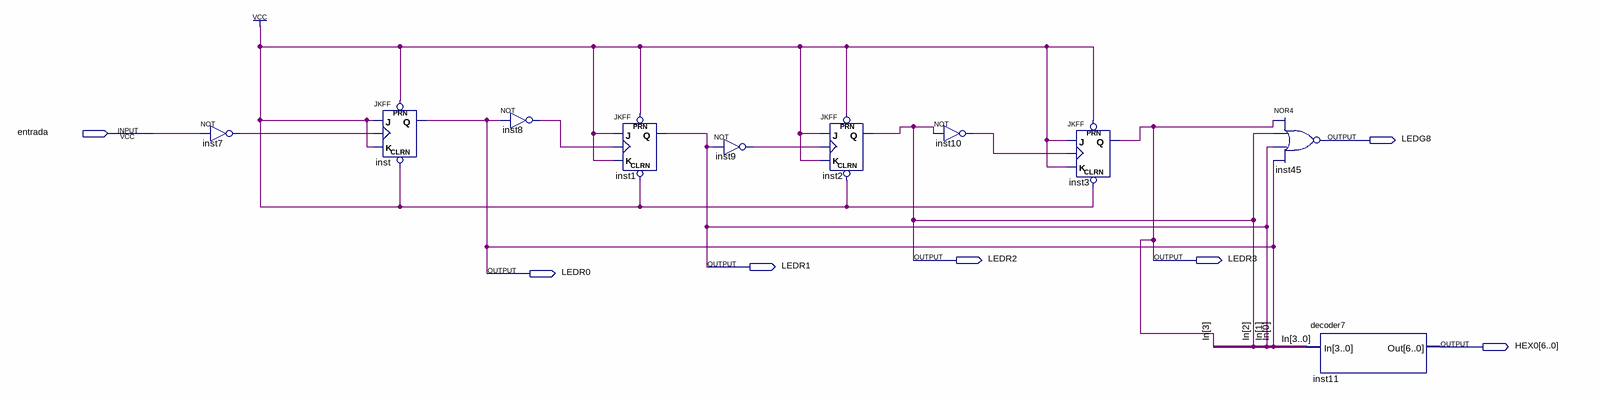
[diagram p0: schematic sheet]
// Quartus schematic experimento22.bdf as structural Verilog: 10 symbols, 7 pins
module experimento22 (
  input  entrada,
  output LEDG8,
  output LEDR2,
  output LEDR3,
  output LEDR1,
  output LEDR0,
  output [6:0] HEX0
);

  wire inst7_out, inst8_out, inst9_out, inst10_out;

  not inst7 (inst7_out, entrada);
  JKFF inst (.PRN(1'b1), .CLRN(1'b1), .K(1'b1), .J(1'b1), .CLK(inst7_out), .Q(LEDR0));
  not inst8 (inst8_out, LEDR0);
  JKFF inst1 (.PRN(1'b1), .CLRN(1'b1), .K(1'b1), .J(1'b1), .CLK(inst8_out), .Q(LEDR1));
  not inst9 (inst9_out, LEDR1);
  JKFF inst2 (.PRN(1'b1), .CLRN(1'b1), .K(1'b1), .J(1'b1), .CLK(inst9_out), .Q(LEDR2));
  not inst10 (inst10_out, LEDR2);
  JKFF inst3 (.PRN(1'b1), .CLRN(1'b1), .K(1'b1), .J(1'b1), .CLK(inst10_out), .Q(LEDR3));
  nor inst45 (LEDG8, LEDR3, LEDR2, LEDR1, LEDR0);
  decoder7 inst11 (.In({LEDR3, LEDR2, LEDR1, LEDR0}), .Out(HEX0));

  // Other names for the same wires on the sheet: In[3:0] = {LEDR3, LEDR2, LEDR1, LEDR0}
endmodule
